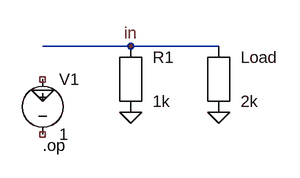
[diagram p0: schematic load_name_op.asc]
load_name_op.asc, the LTspice schematic file:
Version 4
SHEET 1 400 240
WIRE 32 32 160 32
WIRE 160 32 288 32
FLAG 160 32 in
FLAG 32 96 0
FLAG 160 128 0
FLAG 288 128 0
SYMBOL voltage 32 64 R0
SYMATTR InstName V1
SYMATTR Value 1
SYMBOL res 160 80 R0
SYMATTR InstName R1
SYMATTR Value 1k
SYMBOL res 288 80 R0
SYMATTR InstName Load
SYMATTR Value 2k
TEXT 32 176 Left 2 !.op

The netlist it stands for:
* load_name_op.asc
V1 NC_01 NC_02 1
R1 in 0 1k
R§Load in 0 2k
.op
.backanno
.end